# Altium schematic sheet Mechanical.SchDoc
size A4; SheetNumber: 7; SheetTotal: 7
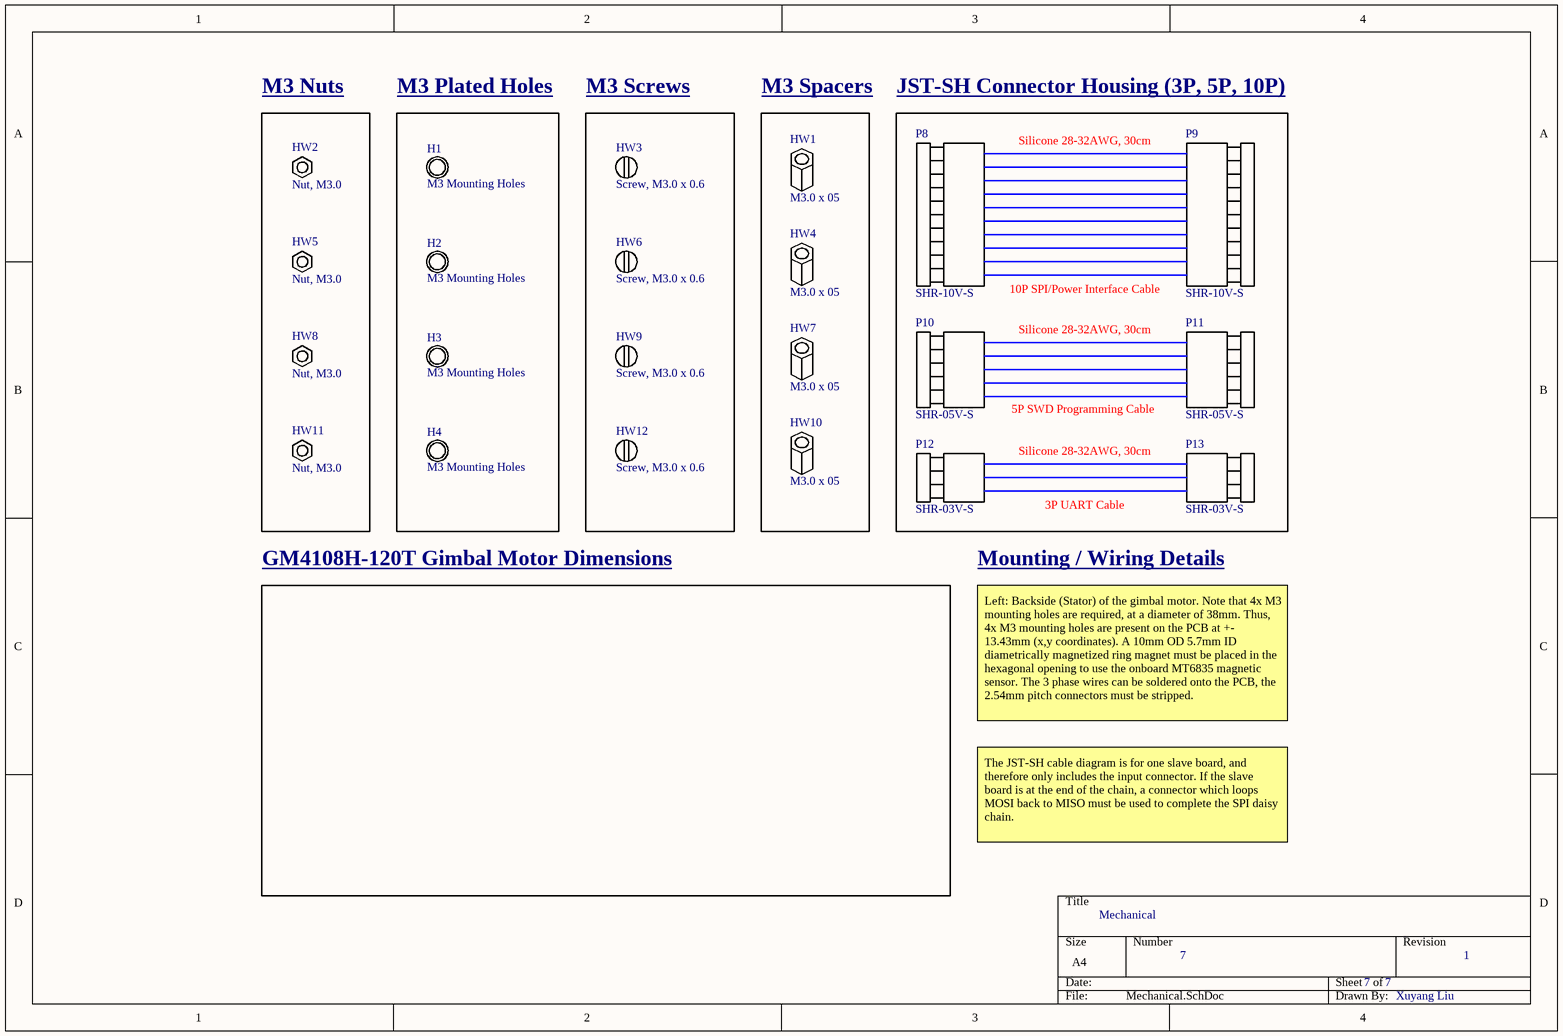
[diagram p0: Mechanical.SchDoc]

## Parts
H1  M3 Mounting Holes  (mechanical)
H2  M3 Mounting Holes  (mechanical)
H3  M3 Mounting Holes  (mechanical)
H4  M3 Mounting Holes  (mechanical)
HW1  M3.0 x 05  (mechanical)
HW2  Nut, M3.0  (mechanical)
HW3  Screw, M3.0 x 0.6  (mechanical)
HW4  M3.0 x 05  (mechanical)
HW5  Nut, M3.0  (mechanical)
HW6  Screw, M3.0 x 0.6  (mechanical)
HW7  M3.0 x 05  (mechanical)
HW8  Nut, M3.0  (mechanical)
HW9  Screw, M3.0 x 0.6  (mechanical)
HW10  M3.0 x 05  (mechanical)
HW11  Nut, M3.0  (mechanical)
HW12  Screw, M3.0 x 0.6  (mechanical)
P8  SHR-10V-S  (mechanical)
P9  SHR-10V-S  (mechanical)
P10  SHR-05V-S  (mechanical)
P11  SHR-05V-S  (mechanical)
P12  SHR-03V-S  (mechanical)
P13  SHR-03V-S  (mechanical)

## Blocks framed on the sheet
M3 Nuts: HW2 HW5 HW8 HW11
M3 Plated Holes: H1-H4
M3 Screws: HW3 HW6 HW9 HW12
M3 Spacers: HW1 HW4 HW7 HW10
JST-SH Connector Housing (3P, 5P, 10P): P8-P13

## Notes on the sheet
- Silicone 28-32AWG, 30cm
- 10P SPI/Power Interface Cable
- 5P SWD Programming Cable
- 3P UART Cable
- GM4108H-120T Gimbal Motor Dimensions
- Mounting / Wiring Details
- Left: Backside (Stator) of the gimbal motor. Note that 4x M3 mounting holes are required, at a diameter of 38mm. Thus, 4x M3 mounting holes are present on the PCB at +- 13.43mm (x,y coordinates). A 10mm OD 5.7mm ID diametrically magnetized ring magnet must be placed in the hexagonal opening to use the onboard MT6835 magnetic sensor. The 3 phase wires can be soldered onto the PCB, the 2.54mm pitch connectors must be stripped.
- The JST-SH cable diagram is for one slave board, and therefore only includes the input connector. If the slave board is at the end of the chain, a connector which loops MOSI back to MISO must be used to complete the SPI daisy chain.
- Mechanical
- 7
- 7     7
- 1
- Xuyang Liu

## Library data of the parts
HW2 HW5 HW8 HW11 = M3.0 Nut
HW3 HW6 HW9 HW12 = M3 x 0.6
P8 P9 = SHR-10V-S: Board Connector, 10 Contact(s), 1 Row(s), Female, Crimp Terminal; Manufacturer: JST; Manufacturer Part Number: SHR-10V-S-B; Body Material: PBT; Connector Type: Receptacle, Socket; Contact Resistance: 20mΩ; Current Rating: 1A; Insulation Resistance: 100MΩ; Max Voltage Rating (AC): 50V; Number of Contacts: 10; Pitch: 990.6µm; Wire/Cable Gauge: 28AWG; Wire Gauge (Max): 32AWG; Supplier 1: DigiKey; RoHS: Compliant; Category: Card Edge Connectors; Stock 1: 1690; Pricing 1: 1=0.17, 10=0.148, 25=0.1384, 50=0.1318, 100=0.1256, 250=0.11768, 500=0.11206, 2000=0.10161, 4000=0.09675 (USD); China RoHS: Compliant; Color: White; Depth: 5mm; Export Control Classification Number (ECCN) Code: EAR99; Flammability Rating: UL94 V-0; Gender: Female; Height: 1.016mm; Housing Color: White; Harmonized Tariff Schedule (HTS) Code: 8536.69.40.40; Introduction Date: 1998-02-05; Lead Free: Lead Free; Lead Pitch: 1mm; Length: 13mm; Lifecycle Status: Production; Material: PBT; Max Current Rating: 1A; Max Operating Temperature: 85°C; Min Operating Temperature: -25°C; Mount: Cable; Number of Pins: 10; Number of Positions: 10; Number of Rows: 1; Orientation: Straight; Packaging: Bulk; REACH SVHC: No; Termination: Crimp; Voltage Rating: 50V; Voltage Rating (AC): 50V; Weight: 28.349523g; Width: 1.016mm; Wire Gauge (Min): 28AWG; ComponentLink1URL: https://datasheet.octopart.com:443/SHR-10V-S-B-JST-datasheet-152738602.pdf?src-supplier=Upverter; ComponentLink1Description: https://datasheet.octopart.com:443/SHR-10V-S-B-JST-datasheet-152738602.pdf?src-supplier=Upverter; ComponentLink2URL: https://datasheet.octopart.com:443/SHR-10V-S-B-JST-datasheet-169969348.pdf?src-supplier=IHS; ComponentLink2Description: https://datasheet.octopart.com:443/SHR-10V-S-B-JST-datasheet-169969348.pdf?src-supplier=IHS; ComponentLink3URL: https://datasheet.octopart.com:443/SHR-10V-S-B-JST-datasheet-5322443.pdf?src-supplier=element14+APAC; ComponentLink3Description: https://datasheet.octopart.com:443/SHR-10V-S-B-JST-datasheet-5322443.pdf?src-supplier=element14+APAC; ComponentLink4URL: https://datasheet.octopart.com:443/SHR-10V-S-B-JST-datasheet-62336359.pdf?src-supplier=element14+APAC; ComponentLink4Description: https://datasheet.octopart.com:443/SHR-10V-S-B-JST-datasheet-62336359.pdf?src-supplier=element14+APAC; ComponentLink5URL: https://datasheet.octopart.com:443/SHR-10V-S-B-JST-datasheet-120967.pdf?src-supplier=Future+Electronics; ComponentLink5Description: https://datasheet.octopart.com:443/SHR-10V-S-B-JST-datasheet-120967.pdf?src-supplier=Future+Electronics; ComponentLink6URL: https://datasheet.octopart.com:443/SHR-10V-S-B-JST-datasheet-12489618.pdf?src-supplier=Future+Electronics; ComponentLink6Description: https://datasheet.octopart.com:443/SHR-10V-S-B-JST-datasheet-12489618.pdf?src-supplier=Future+Electronics; ComponentLink7URL: https://datasheet.octopart.com:443/SHR-10V-S-B-JST-datasheet-8330955.pdf?src-supplier=Future+Electronics; ComponentLink7Description: https://datasheet.octopart.com:443/SHR-10V-S-B-JST-datasheet-8330955.pdf?src-supplier=Future+Electronics; Supplier Part Number 1: 455-1385-ND
P10 P11 = SHR-05V-S: Board Connector, 5 Contact(s), 1 Row(s), Female, Straight, 0.039 inch Pitch, White Insulator; Manufacturer: JST; Manufacturer Part Number: SHR-05V-S-B; Connector Type: Receptacle, Socket; Contact Resistance: 40mΩ; Current Rating: 1A; Insulation Resistance: 100MΩ; Number of Contacts: 5; Pitch: 990.6µm; Voltage Rating: 50V; Supplier 1: DigiKey; RoHS: Compliant; Category: Card Edge Connectors; Stock 1: 7221; Pricing 1: 1=0.12, 10=0.101, 25=0.0952, 50=0.0904, 100=0.0861, 250=0.08072, 500=0.07688, 2000=0.0697, 4000=0.06636 (USD); China RoHS: Compliant; Color: White; Depth: 5mm; Export Control Classification Number (ECCN) Code: EAR99; Flammability Rating: UL94 V-0; Gender: Female; Height: 1.016mm; Housing Material: PBT; Harmonized Tariff Schedule (HTS) Code: 8536.69.40.40; Insulation Color: White; Introduction Date: 1998-02-05; Lead Free: Lead Free; Lead Pitch: 1mm; Length: 8mm; Lifecycle Status: Production; Material: PBT; Max Operating Temperature: 85°C; Min Operating Temperature: -25°C; Mount: Cable; Number of Pins: 5; Number of Positions: 5; Number of Rows: 1; Orientation: Straight; Packaging: Bulk; REACH SVHC: Yes; Schedule B: 8536695050|8536695050; Termination: Crimp; Voltage Rating (AC): 50V; Weight: 28.349523g; Width: 2.8mm; ComponentLink1URL: https://datasheet.octopart.com:443/SHR-05V-S-B-JST-datasheet-152738602.pdf?src-supplier=Amar+Radio+Corporation; ComponentLink1Description: https://datasheet.octopart.com:443/SHR-05V-S-B-JST-datasheet-152738602.pdf?src-supplier=Amar+Radio+Corporation; ComponentLink2URL: https://datasheet.octopart.com:443/SHR-05V-S-B-JST-datasheet-169969348.pdf?src-supplier=IHS; ComponentLink2Description: https://datasheet.octopart.com:443/SHR-05V-S-B-JST-datasheet-169969348.pdf?src-supplier=IHS; ComponentLink3URL: https://datasheet.octopart.com:443/SHR-05V-S-B-JST-datasheet-5322443.pdf?src-supplier=element14+APAC; ComponentLink3Description: https://datasheet.octopart.com:443/SHR-05V-S-B-JST-datasheet-5322443.pdf?src-supplier=element14+APAC; ComponentLink4URL: https://datasheet.octopart.com:443/SHR-05V-S-B-JST-datasheet-62336359.pdf?src-supplier=element14+APAC; ComponentLink4Description: https://datasheet.octopart.com:443/SHR-05V-S-B-JST-datasheet-62336359.pdf?src-supplier=element14+APAC; ComponentLink5URL: https://datasheet.octopart.com:443/SHR-05V-S-B-JST-datasheet-120967.pdf?src-supplier=Future+Electronics; ComponentLink5Description: https://datasheet.octopart.com:443/SHR-05V-S-B-JST-datasheet-120967.pdf?src-supplier=Future+Electronics; ComponentLink6URL: https://datasheet.octopart.com:443/SHR-05V-S-B-JST-datasheet-12489618.pdf?src-supplier=Future+Electronics; ComponentLink6Description: https://datasheet.octopart.com:443/SHR-05V-S-B-JST-datasheet-12489618.pdf?src-supplier=Future+Electronics; ComponentLink7URL: https://datasheet.octopart.com:443/SHR-05V-S-B-JST-datasheet-8330955.pdf?src-supplier=Future+Electronics; ComponentLink7Description: https://datasheet.octopart.com:443/SHR-05V-S-B-JST-datasheet-8330955.pdf?src-supplier=Future+Electronics; ComponentLink8URL: https://datasheet.octopart.com:443/SHR-05V-S-B-JST-datasheet-12520110.pdf?src-supplier=TME; ComponentLink8Description: https://datasheet.octopart.com:443/SHR-05V-S-B-JST-datasheet-12520110.pdf?src-supplier=TME; Supplier Part Number 1: 455-1380-ND
P12 P13 = SHR-03V-S: Board Connector, 3 Contact(s), 1 Row(s), Female, Crimp Terminal; Manufacturer: JST; Connector Type: Receptacle, Socket; Contact Resistance: 40mΩ; Current Rating: 1A; Insulation Resistance: 100MΩ; Number of Contacts: 3; Pitch: 990.6µm; Wire Gauge (Max): 28AWG; Wire Gauge (Min): 32AWG; Supplier 1: DigiKey; Manufacturer Part Number: SHR-03V-S; RoHS: Compliant; Category: Card Edge Connectors; Stock 1: 11386; Pricing 1: 1=0.1, 10=0.078, 25=0.0728, 50=0.0692, 100=0.0659, 250=0.06176, 500=0.05882, 2000=0.05332, 4000=0.05077 (USD); China RoHS: Compliant; Color: Natural; Contact Gender: Female; Height: 5mm; Lead Free: Lead Free; Lead Pitch: 1mm; Length: 4mm; Lifecycle Status: Production; Max Operating Temperature: 85°C; Min Operating Temperature: -25°C; Mount: Free Hanging; Number of Pins: 3; Number of Positions: 3; Number of Rows: 1; Packaging: Bulk; Termination: Crimp; Width: 2.8mm; ComponentLink1URL: https://datasheet.octopart.com:443/SHR-03V-S-JST-datasheet-169969348.pdf?src-supplier=IHS; ComponentLink1Description: https://datasheet.octopart.com:443/SHR-03V-S-JST-datasheet-169969348.pdf?src-supplier=IHS; ComponentLink2URL: https://datasheet.octopart.com:443/SHR-03V-S-JST-datasheet-120967.pdf?src-supplier=Future+Electronics; ComponentLink2Description: https://datasheet.octopart.com:443/SHR-03V-S-JST-datasheet-120967.pdf?src-supplier=Future+Electronics; ComponentLink3URL: https://datasheet.octopart.com:443/SHR-03V-S-JST-datasheet-12489618.pdf?src-supplier=Future+Electronics; ComponentLink3Description: https://datasheet.octopart.com:443/SHR-03V-S-JST-datasheet-12489618.pdf?src-supplier=Future+Electronics; ComponentLink4URL: https://datasheet.octopart.com:443/SHR-03V-S-JST-datasheet-8330955.pdf?src-supplier=Future+Electronics; ComponentLink4Description: https://datasheet.octopart.com:443/SHR-03V-S-JST-datasheet-8330955.pdf?src-supplier=Future+Electronics; ComponentLink5URL: https://datasheet.octopart.com:443/SHR-03V-S-JST-datasheet-152738602.pdf?src-supplier=LKR; ComponentLink5Description: https://datasheet.octopart.com:443/SHR-03V-S-JST-datasheet-152738602.pdf?src-supplier=LKR